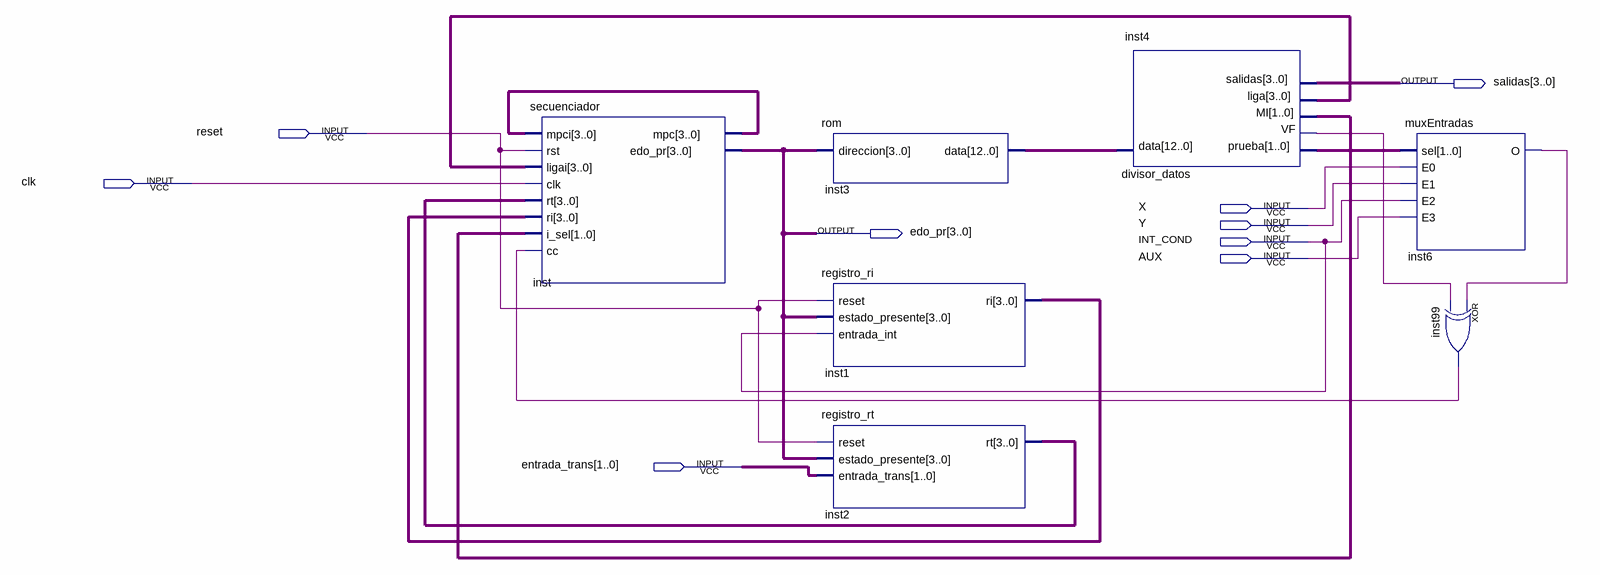
[diagram p0: schematic sheet]
// Quartus schematic practica6_2.bdf as structural Verilog: 7 symbols, 9 pins
module practica6_2 (
  input  reset,
  input  clk,
  input  X,
  input  Y,
  input  INT_COND,
  input  AUX,
  input  [1:0] entrada_trans,
  output [3:0] salidas,
  output [3:0] edo_pr
);

  wire inst4_vf, inst6_o, inst99_out;
  wire [1:0] inst4_mi, inst4_prueba;
  wire [3:0] inst1_ri, inst2_rt, inst4_liga, inst_mpc;
  wire [12:0] inst3_data;

  secuenciador inst (
    .mpci(inst_mpc), .rst(reset), .ligai(inst4_liga), .clk(clk), .rt(inst2_rt), .ri(inst1_ri),
    .i_sel(inst4_mi), .cc(inst99_out), .mpc(inst_mpc), .edo_pr(edo_pr));
  rom inst3 (.direccion(edo_pr), .data(inst3_data));
  registro_ri inst1 (.reset(reset), .estado_presente(edo_pr), .entrada_int(INT_COND), .ri(inst1_ri));
  registro_rt inst2 (.reset(reset), .estado_presente(edo_pr), .entrada_trans(entrada_trans), .rt(inst2_rt));
  divisor_datos inst4 (
    .data(inst3_data), .prueba(inst4_prueba), .VF(inst4_vf), .MI(inst4_mi), .liga(inst4_liga),
    .salidas(salidas));
  muxEntradas inst6 (.sel(inst4_prueba), .E0(X), .E1(Y), .E2(INT_COND), .E3(AUX), .O(inst6_o));
  xor inst99 (inst99_out, inst6_o, inst4_vf);
endmodule
